# Altium schematic sheet Control_Sheet.SchDoc
size A
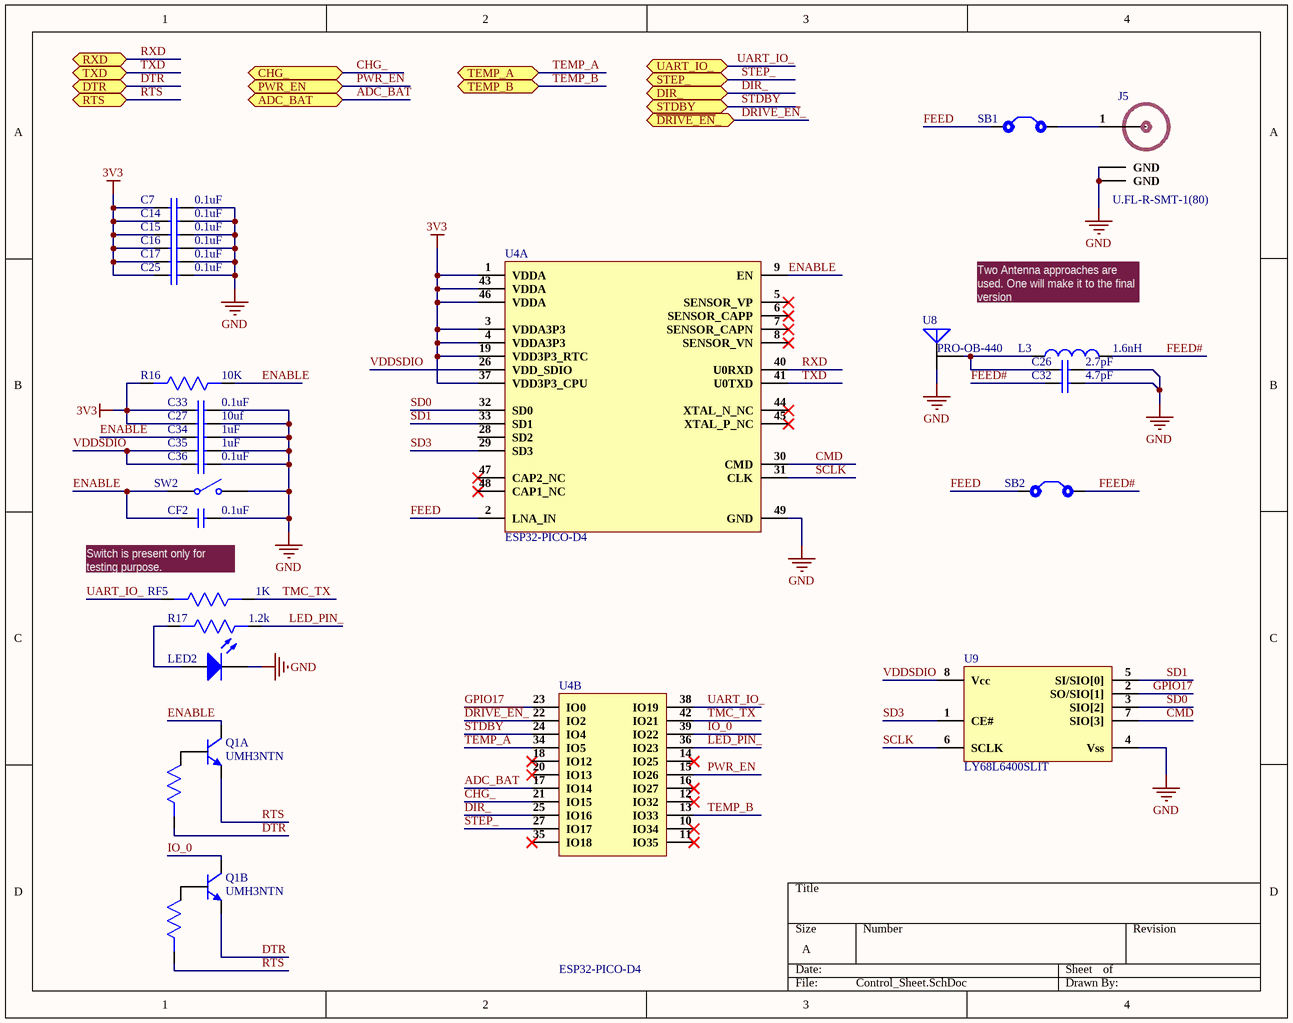
[diagram p0: Control_Sheet.SchDoc]

## Parts
C7  0.1uF  [CAP 0201]
C14  0.1uF  [CAP 0201]
C15  0.1uF  [CAP 0201]
C16  0.1uF  [CAP 0201]
C17  0.1uF  [CAP 0201]
C25  0.1uF  [CAP 0201]
C26  2.7pF  [Cap0402]
C27  10uf  [Cap0603]
C32  4.7pF  [Cap0402]
C33  0.1uF  [CAP 0201]
C34  1uF  [CAP 0201]
C35  1uF  [CAP 0201]
C36  0.1uF  [CAP 0201]
CF2  0.1uF  [CAP 0201]
J5  U.FL-R-SMT-1(80)  [U.FL-R-SMT-1(80)]
L3  1.6nH  [Ind 0402]
LED2  IN-S63AT5UW  [LED 0603]  (value not drawn)
Q1  UMH3NTN  [SOT-363]  (parts A,B of 2)
R16  10K  [Res-0201]
R17  1.2k  [Res-0201]
RF5  1K  [Res-0201]
SB1  Solder Bridge  [Solder Bridge]  (value not drawn)
SB2  Solder Bridge  [Solder Bridge]  (value not drawn)
SW2  434121025816  [434121025816]  (value not drawn)
U4  ESP32-PICO-D4  [48-SMD Module]  (parts A,B of 2)
U8  PRO-OB-440  [PRO-OB-440]
U9  LY68L6400SLIT  [SOP-8]

## Ports
ADC_BAT (bidir), CHG_ (bidir), DIR_ (bidir), DTR (bidir), PWR_EN (bidir), RTS (bidir), RXD (bidir), STDBY (bidir), STEP_ (bidir), TEMP_A (bidir), TEMP_B (bidir), TXD (bidir), UART_IO_ (bidir), ~{DRI}~{VE_EN}_ (bidir)

## Nets
3V3: C7.1 C14.1 C15.1 C16.1 C17.1 C25.1 C27.1 C33.1 R16.2 U4.1(VDDA) U4.3(VDDA3P3) U4.4(VDDA3P3) U4.19(VDD3P3_RTC) U4.37(VDD3P3_CPU) U4.43(VDDA) U4.46(VDDA)
GND: C7.2 C14.2 C15.2 C16.2 C17.2 C25.2 C26.2 C27.2 C32.2 C33.2 C34.2 C35.2 C36.2 CF2.2 J5.2(GND) J5.3(GND) LED2.1(K) SW2.2 U4.49(GND) U8.1(A) U9.4(Vss)
~{DRI}~{VE_EN}_: U4.22(IO2) ; port ~{DRI}~{VE_EN}_
ADC_BAT: U4.17(IO14) ; port ADC_BAT
CHG_: U4.21(IO15) ; port CHG_
CMD: U4.30(CMD) U9.7(SIO[3])
DIR_: U4.25(IO16) ; port DIR_
DTR: Q1.2 Q1.4(E) ; port DTR
ENABLE: C34.1 CF2.1 Q1.6(C) R16.1 SW2.1 U4.9(EN)
FEED: SB1.1 SB2.1 U4.2(LNA_IN)
FEED#: C32.1 L3.2 SB2.2
GPIO17: U4.23(IO0) U9.2(SO/SIO[1])
IO_0: Q1.3(C) U4.39(IO22)
LED_PIN_: R17.1 U4.36(IO23)
PWR_EN: U4.15(IO26) ; port PWR_EN
RTS: Q1.1(E) Q1.5 ; port RTS
RXD: U4.40(U0RXD) ; port RXD
SCLK: U4.31(CLK) U9.6(SCLK)
SD0: U4.32(SD0) U9.3(SIO[2])
SD1: U4.33(SD1) U9.5(SI/SIO[0])
SD3: U4.29(SD3) U9.1(CE#)
STDBY: U4.24(IO4) ; port STDBY
STEP_: U4.27(IO17) ; port STEP_
TEMP_A: U4.34(IO5) ; port TEMP_A
TEMP_B: U4.13(IO33) ; port TEMP_B
TMC_TX: RF5.1 U4.42(IO21)
TXD: U4.41(U0TXD) ; port TXD
UART_IO_: RF5.2 U4.38(IO19) ; port UART_IO_
VDDSDIO: C35.1 C36.1 U4.26(VDD_SDIO) U9.8(Vcc)
NetC26_1: C26.1 L3.1 U8.2(A)
NetJ5_1: J5.1(RF_IN) SB1.2
NetLED2_2: LED2.2(A) R17.2

Not connected (* = marked no-connect by the designer): U4 5(SENSOR_VP)* 6(SENSOR_CAPP)* 7(SENSOR_CAPN)* 8(SENSOR_VN)* 10(IO34)* 11(IO35)* 12(IO32)* 14(IO25)* 16(IO27)* 18(IO12)* 20(IO13)* 28(SD2) 35(IO18)* 44(XTAL_N_NC)* 45(XTAL_P_NC)* 47(CAP2_NC)* 48(CAP1_NC)*; U8 3(A) 4(A)

## Notes on the sheet
- Two Antenna approaches are used. One will make it to the final version
- Switch is present only for testing purpose.

## Library data of the parts
C7 C14-C17 C25 C33 C36 CF2 = GRM033R6YA104ME14D: CAP CER 0.1UF 35V X5R 0201; Manufacturer: Murata; Tolerance: 20%; Capacitance: 100nF; Supplier 1: Digi-Key; Manufacturer Part Number: GRM033R6YA104ME14D; RoHS: Yes; Category: Ceramic Capacitors; Stock 1: 49800; Pricing 1: 1=0.10000, 10=0.05600, 50=0.03040, 100=0.02490, 500=0.01778, 1000=0.01398, 2500=0.01270, 5000=0.01169 (USD); Mount: Surface Mount; Case/Package: 0201; Weight: 1.2E-05oz; Case Code (Metric): 0603; Case Code (Imperial): 0201; Min Operating Temperature: -55°C; Max Operating Temperature: 85°C; Dielectric: X5R; Termination: SMD/SMT; Voltage Rating (DC): 35V; Package Quantity: 15000; Packaging: Tape and Reel; Voltage Rating: 35V; Length: 0.024inch; Height: 0.3mm; Width: 0.012inch; Thickness: 0.013inch; ComponentLink1URL: http://www.mouser.com/ds/2/281/c02e-2905.pdf?src-supplier=Mouser; ComponentLink1Description: http://www.mouser.com/ds/2/281/c02e-2905.pdf?src-supplier=Mouser; ComponentLink2URL: http://search.murata.co.jp/Ceramy/image/img/A01X/G101/ENG/GRM033R6YA104ME14-01.pdf?src-supplier=Digi-Key; ComponentLink2Description: http://search.murata.co.jp/Ceramy/image/img/A01X/G101/ENG/GRM033R6YA104ME14-01.pdf?src-supplier=Digi-Key; Supplier Part Number 1: 490-10431-1-ND
C26 = 04023A2R7BAT2A: CAP CER 2.7PF 25V NP0 0402; Manufacturer: Kyocera AVX; Dielectric: C0G; Temperature Coefficient: 0ppm/°C; Supplier 1: Digi-Key; Manufacturer Part Number: 04023A2R7BAT2A; Stock 1: 28479; Pricing 1: 1=0.32, 10=0.218, 50=0.1452, 100=0.1234, 500=0.08712, 1000=0.07623, 2500=0.0726, 5000=0.06716 (USD); Mount: Surface Mount; Case/Package: 0402; Case Code (Metric): 1005; Case Code (Imperial): 0402; Min Operating Temperature: -55°C; Max Operating Temperature: 125°C; Package Quantity: 10000; Capacitance: 2.7pF; Voltage Rating: 25V; Packaging: Tape and Reel; Voltage Rating (DC): 25V; Termination: SMD/SMT; Length: 1mm; Width: 0.02inch; Thickness: 0.022inch; Depth: 0.5mm; Radiation Hardening: No; Lead Free: Lead Free; ComponentLink1URL: http://datasheets.avx.com/C0GNP0-Dielectric.pdf?src-supplier=Digi-Key; ComponentLink1Description: http://datasheets.avx.com/C0GNP0-Dielectric.pdf?src-supplier=Digi-Key; ComponentLink2URL: http://www.avx.com/docs/Catalogs/ccog.pdf?src-supplier=Future+Electronics; ComponentLink2Description: http://www.avx.com/docs/Catalogs/ccog.pdf?src-supplier=Future+Electronics; ComponentLink3URL: http://www.avxcorp.com/docs/Catalogs/ccog.pdf?src-supplier=Avnet; ComponentLink3Description: http://www.avxcorp.com/docs/Catalogs/ccog.pdf?src-supplier=Avnet; Supplier Part Number 1: 478-12612-6-ND
C27 = GRM188R61E106KA73D: CAP CER 10UF 25V X5R 0603; Manufacturer: Murata; Supplier 1: Digi-Key; Manufacturer Part Number: GRM188R61E106KA73D; Stock 1: 20478; Pricing 1: 1=0.32, 10=0.225, 50=0.1574, 100=0.135, 500=0.10122, 1000=0.08548 (USD); Case/Package: 0603; ComponentLink1URL: https://search.murata.co.jp/Ceramy/image/img/A01X/G101/ENG/GRM188R61E106KA73-01.pdf?src-supplier=Digi-Key; ComponentLink1Description: https://search.murata.co.jp/Ceramy/image/img/A01X/G101/ENG/GRM188R61E106KA73-01.pdf?src-supplier=Digi-Key; Supplier Part Number 1: 490-18214-6-ND
C32 = 885012005023: CAP CER 4.7PF 16V C0G/NP0 0402; Manufacturer: Wurth Electronics; Supplier 1: Digi-Key; Manufacturer Part Number: 885012005023; Stock 1: 8921; Pricing 1: 1=0.1, 10=0.015, 100=0.0134, 500=0.01188 (USD); Mount: Surface Mount; Case/Package: 0402; Case Code (Metric): 1005; Case Code (Imperial): 0402; Min Operating Temperature: -55°C; Max Operating Temperature: 125°C; Packaging: Cut Tape; Capacitance: 4.7pF; Voltage Rating: 16V; Length: 0.039inch; Width: 0.02inch; Thickness: 0.022inch; ComponentLink1URL: https://katalog.we-online.de/pbs/datasheet/885012005023.pdf?src-supplier=Digi-Key; ComponentLink1Description: https://katalog.we-online.de/pbs/datasheet/885012005023.pdf?src-supplier=Digi-Key; ComponentLink2URL: http://www.farnell.com/datasheets/2546554.pdf?src-supplier=Farnell; ComponentLink2Description: http://www.farnell.com/datasheets/2546554.pdf?src-supplier=Farnell; ComponentLink3URL: http://www.farnell.com/datasheets/2546554.pdf?src-supplier=Newark; ComponentLink3Description: http://www.farnell.com/datasheets/2546554.pdf?src-supplier=Newark; ComponentLink4URL: http://www.farnell.com/datasheets/2546554.pdf?src-supplier=Element14; ComponentLink4Description: http://www.farnell.com/datasheets/2546554.pdf?src-supplier=Element14; Supplier Part Number 1: 732-7439-6-ND
C34 C35 = CL03A105MO3NRNH: CAP CER 1UF 16V X5R 0201; Manufacturer: Samsung; Tolerance: 20%; Supplier 1: Digi-Key; Manufacturer Part Number: CL03A105MO3NRNH; RoHS: Yes; Category: Ceramic Capacitors; Stock 1: 66067; Pricing 1: 1=0.27000, 10=0.18500, 50=0.11080, 100=0.09360, 500=0.06406, 1000=0.05667, 2500=0.05421, 5000=0.04928 (USD); Mount: Surface Mount; Case/Package: 0201; Case Code (Metric): 0603; Case Code (Imperial): 0201; Min Operating Temperature: -55°C; Max Operating Temperature: 85°C; Packaging: Tape and Reel; Capacitance: 1uF; Voltage Rating: 16V; Length: 0.024inch; Width: 0.012inch; Thickness: 0.013inch; RoHS Compliant: Yes; ComponentLink1URL: http://www.samsungsem.com/kr/support/product-search/mlcc/CL03A105MO3NRNH.jsp?src-supplier=Digi-Key; ComponentLink1Description: http://www.samsungsem.com/kr/support/product-search/mlcc/CL03A105MO3NRNH.jsp?src-supplier=Digi-Key; Supplier Part Number 1: 1276-6798-1-ND
J5 = U.FL-R-SMT-1(80): CONN U.FL RCPT STR 50 OHM SMD; Manufacturer: Hirose; Supplier 1: Future Electronics; Manufacturer Part Number: U.FL-R-SMT-1(80); Stock 1: 1272; Pricing 1: 1=1.07, 500=0.785, 1500=0.74, 2500=0.72, 5000=0.695 (USD); Case/Package: SMD/SMT; Package Quantity: 10000; Packaging: Tape and Reel; Lead Free: Lead Free; ComponentLink1URL: https://www.hirose.com/product/en/download_file/key_name/U.FL-R-SMT-1%2880%29/category/Specification%20Sheet/doc_file_id/37638/?file_category_id=9&item_id=03310472280&is_series=&src-supplier=Digi-Key; ComponentLink1Description: https://www.hirose.com/product/en/download_file/key_name/U.FL-R-SMT-1%2880%29/category/Specification%20Sheet/doc_file_id/37638/?file_category_id=9&item_id=03310472280&is_series=&src-supplier=Digi-Key; ComponentLink2URL: http://www.mouser.com/ds/2/185/U.FL_catalog-939761.pdf?src-supplier=Mouser; ComponentLink2Description: http://www.mouser.com/ds/2/185/U.FL_catalog-939761.pdf?src-supplier=Mouser; Supplier Part Number 1: U.FL-R-SMT-1(80)-CUTT
L3 = HLC021R6BTTR: FIXED IND 1.6NH 660MA 150 MOHM; Manufacturer: Kyocera AVX; Core Material: Non-Magnetic; DC Resistance (DCR): 150mR; Shielding: Unshielded; Self Resonant Frequency: 18GHz; Test Frequency: 450MHz; Q Factor: 25; Supplier 1: Digi-Key; Manufacturer Part Number: HLC021R6BTTR; Stock 1: 5000; Pricing 1: 1=0.41, 10=0.36, 25=0.3152, 50=0.2704, 100=0.2478, 250=0.22524, 500=0.21174, 1000=0.16218, 2500=0.15317 (USD); Mount: Surface Mount; Case/Package: 0402; Case Code (Metric): 1005; Case Code (Imperial): 0402; Min Operating Temperature: -55°C; Max Operating Temperature: 125°C; Inductance: 1.6nH; Max DC Current: 660mA; Packaging: Tape and Reel; Package Quantity: 5000; Current Rating: 660mA; Termination: SMD/SMT; Length: 1mm; Height: 0.35mm; Depth: 0.66mm; Width: 0.023inch; Height - Seated (Max): 0.018inch; Radiation Hardening: No; REACH SVHC: No SVHC; Lead Free: Lead Free; ComponentLink1URL: https://media.digikey.com/pdf/Data%20Sheets/AVX%20PDFs/MLO%20High%20Current%20Inductors.pdf?src-supplier=Digi-Key; ComponentLink1Description: https://media.digikey.com/pdf/Data%20Sheets/AVX%20PDFs/MLO%20High%20Current%20Inductors.pdf?src-supplier=Digi-Key; ComponentLink2URL: http://www.avx.com/docs/catalogs/mlohighcurrentinductor.pdf?src-supplier=Future+Electronics; ComponentLink2Description: http://www.avx.com/docs/catalogs/mlohighcurrentinductor.pdf?src-supplier=Future+Electronics; Supplier Part Number 1: 478-HLC021R6BTCT-ND
LED2 = IN-S63AT5UW: Led White Clear 0603 SMD; Manufacturer: Inolux; Lens Style: Flat; Luminous Intensity: 900mcd; Forward Voltage: 3V; Test Current: 5mA; Viewing Angle: 120°; Lens Size: 0.8mm; Supplier 1: Digi-Key; Manufacturer Part Number: IN-S63AT5UW; RoHS: No; Category: LEDs; Stock 1: 275915; Pricing 1: 1=0.33000, 10=0.17700, 100=0.08210, 500=0.07576, 1000=0.05934, 2000=0.05808 (USD); Mount: Surface Mount; Case/Package: 0603; Color: White; Lens Color: Clear; Case Code (Imperial): 0603; Case Code (Metric): 1608; Packaging: Tape and Reel; Lens Transparency: Clear; Length: 1.6mm; Width: 0.8mm; Height: 0.4mm; ComponentLink1URL: http://www.inolux-corp.com/datasheet/SMDLED/Mono%20Color%20Top%20View/IN-S63AT%20Series_V1.1.pdf?src-supplier=Digi-Key; ComponentLink1Description: http://www.inolux-corp.com/datasheet/SMDLED/Mono%20Color%20Top%20View/IN-S63AT%20Series_V1.1.pdf?src-supplier=Digi-Key; Supplier Part Number 1: 1830-1063-1-ND
Q1 = UMH3NTN: TRANS 2NPN PREBIAS 0.15W UMT6; Manufacturer: Rohm; Collector Emitter Voltage (VCEO): 50V; Emitter Base Voltage (VEBO): 5V; Max Collector Current: 100mA; Element Configuration: Dual; hFE Min: 100; Polarity: NPN; Power Dissipation: 150mW; Transition Frequency: 250MHz; Supplier 1: Digi-Key; Manufacturer Part Number: UMH3NTN; Stock 1: 12797; Pricing 1: 1=0.39, 10=0.293, 25=0.264, 100=0.1392, 500=0.12336, 1000=0.096 (USD); Mount: Surface Mount; Case/Package: SOT-363; Number of Pins: 6; Min Operating Temperature: -55°C; Max Operating Temperature: 150°C; Max Output Current: 100mA; Operating Supply Voltage: 50V; Packaging: Tape and Reel; Package Quantity: 1; Continuous Collector Current: 100mA; Collector Emitter Breakdown Voltage: 50V; Max Power Dissipation: 150mW; Max Breakdown Voltage: 50V; Voltage Rating (DC): 50V; Current Rating: 100mA; Collector Base Voltage (VCBO): 50V; Radiation Hardening: No; REACH SVHC: No SVHC; Lead Free: Lead Free; ComponentLink1URL: http://www.farnell.com/datasheets/1645293.pdf?src-supplier=Element14; ComponentLink1Description: http://www.farnell.com/datasheets/1645293.pdf?src-supplier=Element14; ComponentLink2URL: http://rohmfs.rohm.com/en/products/databook/datasheet/discrete/transistor/digital/emh3t2r-e.pdf?src-supplier=Digi-Key; ComponentLink2Description: http://rohmfs.rohm.com/en/products/databook/datasheet/discrete/transistor/digital/emh3t2r-e.pdf?src-supplier=Digi-Key; ComponentLink3URL: http://rohmfs.rohm.com/en/techdata_basic/transistor/taping/UMT6_TN_taping.pdf?src-supplier=Digi-Key; ComponentLink3Description: http://rohmfs.rohm.com/en/techdata_basic/transistor/taping/UMT6_TN_taping.pdf?src-supplier=Digi-Key; ComponentLink4URL: http://www.produktinfo.conrad.com/datenblaetter/125000-149999/140593-da-01-en-TRANSISTOR_UMH3_NTN_SOT_363.pdf?src-supplier=Conrad; ComponentLink4Description: http://www.produktinfo.conrad.com/datenblaetter/125000-149999/140593-da-01-en-TRANSISTOR_UMH3_NTN_SOT_363.pdf?src-supplier=Conrad; Supplier Part Number 1: UMH3NTNCT-ND
R16 = RC0201JR-0710KL: RES SMD 10K OHM 5% 1/20W 0201; Manufacturer: Yageo; Voltage Rating (DC): 25V; Power Rating: 50mW; Resistance: 10kR; Temperature Coefficient: 200ppm/°C; Case Code (Imperial): 0201; Case Code (Metric): 0603; Case/Package: 0201; Category: Chip SMD Resistors; Contact Plating: Tin,Matte; Depth: 0.3mm; Lead Free: Lead Free; Length: 0.6mm; Manufacturer Part Number: RC0201JR-0710KL; Max Operating Temperature: 125°C; Military Standard: Not; Min Operating Temperature: -55°C; Packaging: Tape and Reel; Radiation Hardening: No; REACH SVHC: Unknown; Resistor Type: Thick Film; Termination: SMD/SMT; Tolerance: 5%; Voltage Rating: 25V; ComponentLink1Description: New link; ComponentLink1URL: *; Supplier 1: Digi-Key; RoHS: Yes; Stock 1: 1488597; Pricing 1: 1=0.10000, 10=0.02600, 100=0.01050, 1000=0.00472, 2500=0.00410, 5000=0.00338 (USD); ComponentLink2URL: https://datasheet.ciiva.com/8891/pyu-rc0201-51-rohs-l-8-8891388.pdf?src-supplier=Avnet; ComponentLink2Description: https://datasheet.ciiva.com/8891/pyu-rc0201-51-rohs-l-8-8891388.pdf?src-supplier=Avnet; ComponentLink3URL: https://datasheet.ciiva.com/7672/1563626-7672253.pdf?src-supplier=Element14; ComponentLink3Description: https://datasheet.ciiva.com/7672/1563626-7672253.pdf?src-supplier=Element14; ComponentLink4URL: https://datasheet.ciiva.com/28405/pyu-rc0201-51-rohs-l-8-28405613.pdf?src-supplier=Avnet+Europe; ComponentLink4Description: https://datasheet.ciiva.com/28405/pyu-rc0201-51-rohs-l-8-28405613.pdf?src-supplier=Avnet+Europe; ComponentLink5URL: https://datasheet.ciiva.com/7672/1563626-7672254.pdf?src-supplier=Element14; ComponentLink5Description: https://datasheet.ciiva.com/7672/1563626-7672254.pdf?src-supplier=Element14; ComponentLink6URL: https://datasheet.ciiva.com/7660/1421516-7660810.pdf?src-supplier=Element14; ComponentLink6Description: https://datasheet.ciiva.com/7660/1421516-7660810.pdf?src-supplier=Element14; ComponentLink7URL: https://datasheet.ciiva.com/16856/pyu-rc0201-51-rohs-l-8-16856011.pdf?src-supplier=Avnet+Europe; ComponentLink7Description: https://datasheet.ciiva.com/16856/pyu-rc0201-51-rohs-l-8-16856011.pdf?src-supplier=Avnet+Europe; ComponentLink8URL: https://datasheet.ciiva.com/46391/1421516-46391291.pdf?src-supplier=Element14; ComponentLink8Description: https://datasheet.ciiva.com/46391/1421516-46391291.pdf?src-supplier=Element14; Supplier Part Number 1: 311-10KNCT-ND
R17 = RC0201JR-071K2L: RES SMD 1.2K OHM 5% 1/20W 0201; Manufacturer: Yageo; Temperature Coefficient: 200ppm/°C; Resistance: 1.2kR; Max Power Dissipation: 50mW; Supplier 1: Digi-Key; Manufacturer Part Number: RC0201JR-071K2L; RoHS: Yes; Category: Chip SMD Resistors; Stock 1: 285; Pricing 1: 1=0.10000, 10=0.02600, 100=0.01040, 1000=0.00466, 2500=0.00405, 5000=0.00334 (USD); Case/Package: 0201; Contact Plating: Tin,Matte; Case Code (Imperial): 0201; Case Code (Metric): 0603; Min Operating Temperature: -55°C; Max Operating Temperature: 125°C; Resistor Type: Thick Film; Tolerance: 5%; Number of Terminations: 2; Package Quantity: 1; Packaging: Tape and Reel; Features: Moisture Resistant; Length: 0.024inch; Width: 0.012inch; Height: 0.01inch; Radiation Hardening: No; ComponentLink1URL: https://datasheet.ciiva.com/8895/pyu-rc0201-51-rohs-l-8-8895816.pdf?src-supplier=Avnet; ComponentLink1Description: https://datasheet.ciiva.com/8895/pyu-rc0201-51-rohs-l-8-8895816.pdf?src-supplier=Avnet; ComponentLink2URL: https://datasheet.ciiva.com/16855/pyu-rc0201-51-rohs-l-8-16855241.pdf?src-supplier=Avnet+Europe; ComponentLink2Description: https://datasheet.ciiva.com/16855/pyu-rc0201-51-rohs-l-8-16855241.pdf?src-supplier=Avnet+Europe; ComponentLink3URL: https://datasheet.ciiva.com/2462/pyu-r-int-thick-7-2462826.pdf?src-supplier=Digi-Key; ComponentLink3Description: https://datasheet.ciiva.com/2462/pyu-r-int-thick-7-2462826.pdf?src-supplier=Digi-Key; ComponentLink4URL: https://datasheet.ciiva.com/2462/pyu-r-int-thick-7-2462827.pdf?src-supplier=Digi-Key; ComponentLink4Description: https://datasheet.ciiva.com/2462/pyu-r-int-thick-7-2462827.pdf?src-supplier=Digi-Key; ComponentLink5URL: https://datasheet.ciiva.com/28418/pyu-rc0201-51-rohs-l-8-28418507.pdf?src-supplier=Avnet+Europe; ComponentLink5Description: https://datasheet.ciiva.com/28418/pyu-rc0201-51-rohs-l-8-28418507.pdf?src-supplier=Avnet+Europe; ComponentLink6URL: https://datasheet.ciiva.com/2462/pyu-r-int-thick-7-2462828.pdf?src-supplier=Digi-Key; ComponentLink6Description: https://datasheet.ciiva.com/2462/pyu-r-int-thick-7-2462828.pdf?src-supplier=Digi-Key; Supplier Part Number 1: 311-1.2KNCT-ND
RF5 = RC0201FR-071KP: RES 1K OHM 1% 1/20W 0201; Manufacturer: Yageo; Supplier 1: Digi-Key; Manufacturer Part Number: RC0201FR-071KP; RoHS: Yes; Stock 1: 4800; Pricing 1: 1=0.11000, 10=0.10200, 100=0.03940, 1000=0.01734, 2500=0.01497, 5000=0.01340 (USD); RoHS Compliant: Yes; Supplier Part Number 1: 13-RC0201FR-071KPCT-ND
SB1 SB2 = Solder Bridge: Solder Bridge ON
SW2 = 434121025816: SWITCH TACTILE SPST-NO 0.05A 12V; Manufacturer: Wurth Electronics; Mechanical Life: 50000Cycles; Actuator Material: Polymer,Liquid Crystal Polymer; Contact Current Rating: 50mA; Operating Force: 160gf; Illumination Type: Non-Illuminated,Illuminated; Throw Configuration: SPST; Insulation Resistance: 100MR; Switch Travel: 0.25mm; Switch Function: Off-Mom; Actuator Type: Standard; Actuator Length: 0.8mm; Supplier 1: Digi-Key; Manufacturer Part Number: 434121025816; RoHS: Yes; Category: Tactile Switches; Stock 1: 2355; Pricing 1: 1=0.55000, 50=0.50700, 100=0.46100, 500=0.41900, 1000=0.36400 (USD); Mount: Surface Mount; Contact Material: Stainless Steel,Steel; Min Operating Temperature: -40°C; Max Operating Temperature: 85°C; Current Rating: 50mA; Packaging: Tape and Reel; Termination: SMD/SMT; Length: 7.3mm; Width: 3.9mm; Height: 2.5mm; REACH SVHC: No SVHC; Lead Free: Lead Free; ComponentLink1URL: https://datasheet.ciiva.com/30466/0900766b8126b630-30466740.pdf?src-supplier=RSComponents; ComponentLink1Description: https://datasheet.ciiva.com/30466/0900766b8126b630-30466740.pdf?src-supplier=RSComponents; ComponentLink2URL: https://datasheet.ciiva.com/29123/711753-da-01-en-taster-434121025816-29123820.pdf?src-supplier=Conrad; ComponentLink2Description: https://datasheet.ciiva.com/29123/711753-da-01-en-taster-434121025816-29123820.pdf?src-supplier=Conrad; ComponentLink3URL: https://datasheet.ciiva.com/1532/434121025816-1532523.pdf?src-supplier=Element14; ComponentLink3Description: https://datasheet.ciiva.com/1532/434121025816-1532523.pdf?src-supplier=Element14; ComponentLink4URL: https://datasheet.ciiva.com/1633/434121025816-1633932.pdf?src-supplier=Farnell; ComponentLink4Description: https://datasheet.ciiva.com/1633/434121025816-1633932.pdf?src-supplier=Farnell; Supplier Part Number 1: 732-7045-1-ND
U4 = ESP32-PICO-D4: RX TXRX MOD WIFI SURFACE MOUNT; Manufacturer: Espressif Systems; Frequency: 2.5GHz; Interface: I2C,SPI,GPIO,PWM,SDIO,UART; Data Rate: 150Mbps; Sensitivity: -98.4dBm; Memory Size: 4MB; Supplier 1: Digi-Key; Manufacturer Part Number: ESP32-PICO-D4; Stock 1: 5967; Pricing 1: 1=4.5 (USD); Mount: Surface Mount; Case/Package: SMD/SMT; Min Operating Temperature: -40°C; Max Operating Temperature: 85°C; ComponentLink1URL: https://www.espressif.com/sites/default/files/documentation/esp32-pico-d4_datasheet_en.pdf?src-supplier=Digi-Key; ComponentLink1Description: https://www.espressif.com/sites/default/files/documentation/esp32-pico-d4_datasheet_en.pdf?src-supplier=Digi-Key; Supplier Part Number 1: 1904-1029-1-ND
U8 = PRO-OB-440: RF ANT 2.4GHZ STAMPED MET SLD; Manufacturer: Proant; Number of Bands: 1; Return Loss: -10dB; Supplier 1: Digi-Key; Manufacturer Part Number: PRO-OB-440; Stock 1: 23502; Pricing 1: 1=0.74, 10=0.647, 25=0.608, 100=0.4964, 250=0.46104, 500=0.39238 (USD); Mount: Surface Mount; Packaging: Cut Tape; Termination: Solder; ComponentLink1URL: https://media.digikey.com/pdf/Data%20Sheets/Proant%20PDF's/PRO-OB-440_Dwg.PDF?src-supplier=Digi-Key; ComponentLink1Description: https://media.digikey.com/pdf/Data%20Sheets/Proant%20PDF's/PRO-OB-440_Dwg.PDF?src-supplier=Digi-Key; ComponentLink2URL: http://www.proant.se/files/user/Application%20note%20-%20OnBoard%20SMD%20GNSS%20rev%202.0.pdf?src-supplier=Digi-Key; ComponentLink2Description: http://www.proant.se/files/user/Application%20note%20-%20OnBoard%20SMD%20GNSS%20rev%202.0.pdf?src-supplier=Digi-Key; ComponentLink3URL: http://www.proant.se/files/user/Documents/Datasheet%20-%20OnBoard%20SMD%202400%20MHz%20rev%203.pdf?src-supplier=Digi-Key; ComponentLink3Description: http://www.proant.se/files/user/Documents/Datasheet%20-%20OnBoard%20SMD%202400%20MHz%20rev%203.pdf?src-supplier=Digi-Key; Supplier Part Number 1: 1532-1001-6-ND
U9 = LY68L6400SLIT: Volatile 64Mb (8M x 8) SPI/ QPI 2.7V ~ 3.6V SOP-8_150mil RAM RoHS; Manufacturer: Lyontek Inc.; Value: Custom; Manufacturer Part No: LY68L6400SLIT; Package: SOP-8